# Altium schematic sheet MCU.SchDoc
size A4; SheetNumber: 5; SheetTotal: 8
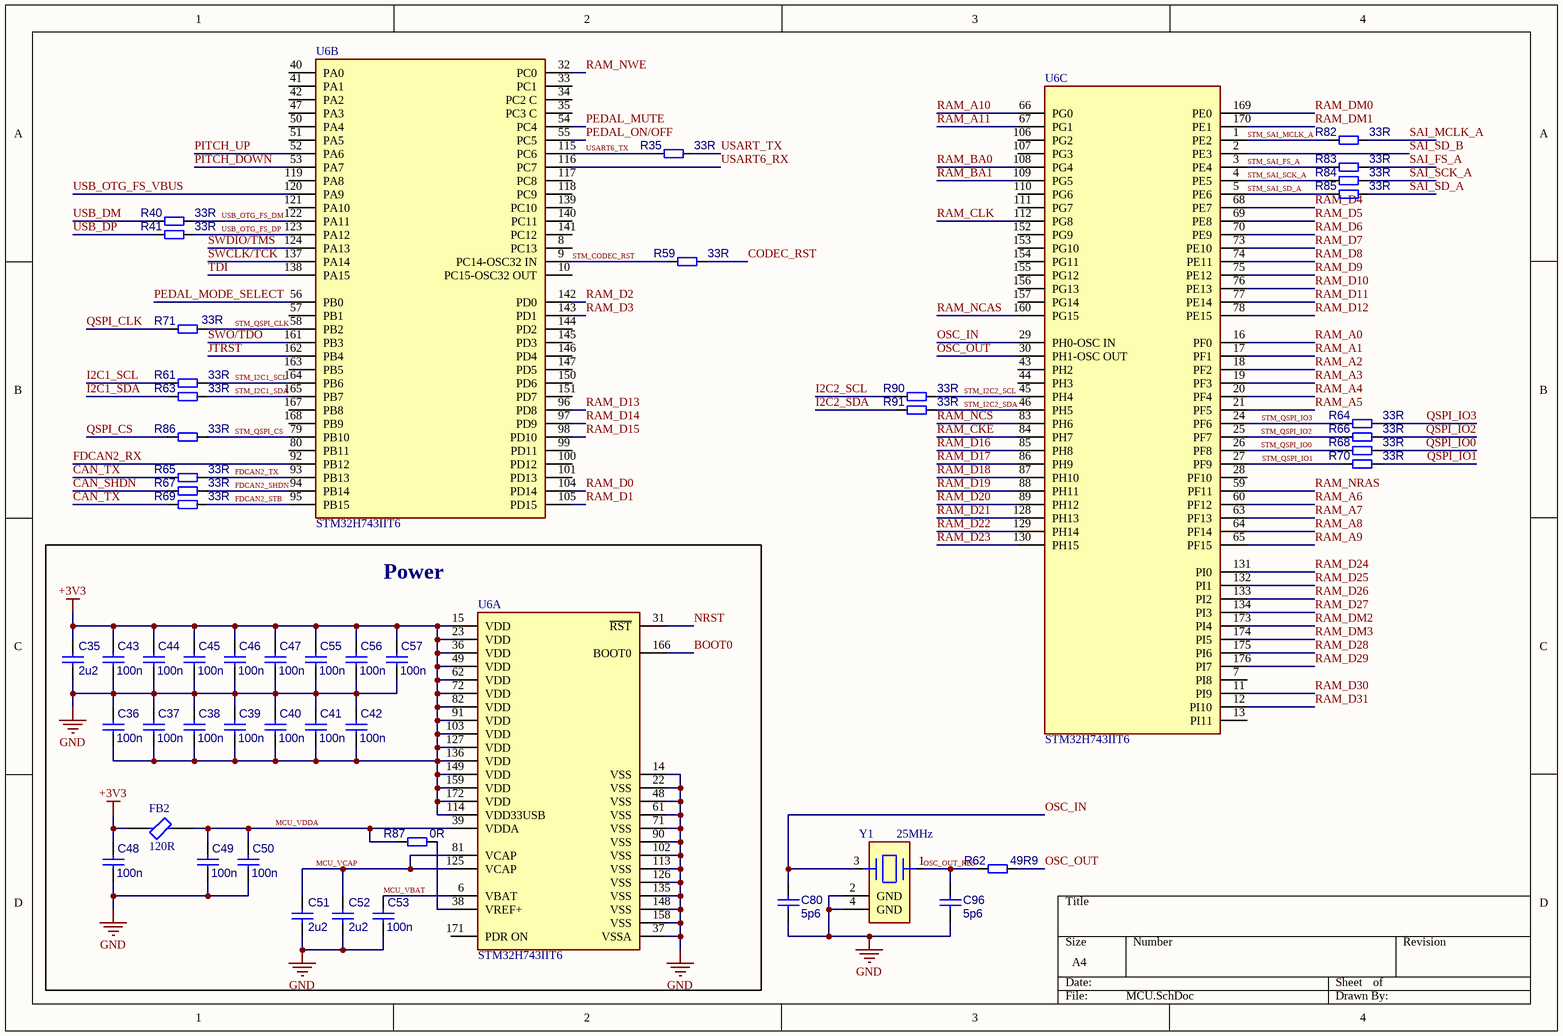
[diagram p0: MCU.SchDoc]

## Parts
C35  2u2  [C_0402]
C36  100n  [CAPC1005X50N_0402]
C37  100n  [CAPC1005X50N_0402]
C38  100n  [CAPC1005X50N_0402]
C39  100n  [CAPC1005X50N_0402]
C40  100n  [CAPC1005X50N_0402]
C41  100n  [CAPC1005X50N_0402]
C42  100n  [CAPC1005X50N_0402]
C43  100n  [CAPC1005X50N_0402]
C44  100n  [CAPC1005X50N_0402]
C45  100n  [CAPC1005X50N_0402]
C46  100n  [CAPC1005X50N_0402]
C47  100n  [CAPC1005X50N_0402]
C48  100n  [CAPC1005X50N_0402]
C49  100n  [CAPC1005X50N_0402]
C50  100n  [CAPC1005X50N_0402]
C51  2u2  [C_0402]
C52  2u2  [C_0402]
C53  100n  [CAPC1005X50N_0402]
C55  100n  [CAPC1005X50N_0402]
C56  100n  [CAPC1005X50N_0402]
C57  100n  [CAPC1005X50N_0402]
C80  5p6  [CAPC1005X50N_0402]
C96  5p6  [CAPC1005X50N_0402]
FB2  120R  [FP-NFZ32BW-w2_8-MFG]
R35  33R  [R_0402]
R40  33R  [R_0402]
R41  33R  [R_0402]
R59  33R  [R_0402]
R61  33R  [R_0402]
R62  49R9  [R_0402]
R63  33R  [R_0402]
R64  33R  [R_0402]
R65  33R  [R_0402]
R66  33R  [R_0402]
R67  33R  [R_0402]
R68  33R  [R_0402]
R69  33R  [R_0402]
R70  33R  [R_0402]
R71  33R  [R_0402]
R82  33R  [R_0402]
R83  33R  [R_0402]
R84  33R  [R_0402]
R85  33R  [R_0402]
R86  33R  [R_0402]
R87  0R  [R_0402]
R90  33R  [R_0402]
R91  33R  [R_0402]
U6  STM32H743IIT6  [FP-LQFP176-1T-MFG]  (parts A,B,C of 3)
Y1  25MHz  [FP-NX2016SA-MFG]

## Blocks framed on the sheet
Power: C35-C53 C55-C57 FB2 R87 U6

## Nets
+3V3: C35.1 C36.2 C37.2 C38.2 C39.2 C40.2 C41.2 C42.2 C43.1 C44.1 C45.1 C46.1 C47.1 C48.1 C55.1 C56.1 C57.1 FB2.1 U6.15(VDD) U6.23(VDD) U6.36(VDD) U6.49(VDD) U6.62(VDD) U6.72(VDD) U6.82(VDD) U6.91(VDD) U6.103(VDD) U6.114(VDD33USB) U6.127(VDD) U6.136(VDD) U6.149(VDD) U6.159(VDD) U6.172(VDD)
GND: C35.2 C36.1 C37.1 C38.1 C39.1 C40.1 C41.1 C42.1 C43.2 C44.2 C45.2 C46.2 C47.2 C48.2 C49.2 C50.2 C51.2 C52.2 C53.2 C55.2 C56.2 C57.2 C80.2 C96.1 U6.14(VSS) U6.22(VSS) U6.37(VSSA) U6.48(VSS) U6.61(VSS) U6.71(VSS) U6.90(VSS) U6.102(VSS) U6.113(VSS) U6.126(VSS) U6.135(VSS) U6.148(VSS) U6.158(VSS) Y1.2(GND) Y1.4(GND)
BOOT0: U6.166(BOOT0)
CAN_SHDN: R67.1
CAN_TX: R65.1 R69.1
CODEC_RST: R59.2
FDCAN2_RX: U6.92(PB12)
FDCAN2_SHDN: R67.2 U6.94(PB14)
FDCAN2_STB: R69.2 U6.95(PB15)
FDCAN2_TX: R65.2 U6.93(PB13)
I2C1_SCL: R61.1
I2C1_SDA: R63.1
I2C2_SCL: R90.1
I2C2_SDA: R91.1
JTRST: U6.162(PB4)
MCU_VBAT: C53.1 U6.6(VBAT)
MCU_VCAP: C51.1 C52.1 U6.81(VCAP) U6.125(VCAP)
MCU_VDDA: C49.1 C50.1 FB2.2 R87.2 U6.39(VDDA)
NRST: U6.31(~{RST})
OSC_IN: C80.1 U6.29(PH0-OSC_IN) Y1.3
OSC_OUT: R62.1 U6.30(PH1-OSC_OUT)
OSC_OUT_RES: C96.2 R62.2 Y1.1
PEDAL_MODE_SELECT: U6.56(PB0)
PEDAL_MUTE: U6.54(PC4)
PEDAL_ON/OFF: U6.55(PC5)
PITCH_DOWN: U6.53(PA7)
PITCH_UP: U6.52(PA6)
QSPI_CLK: R71.2
QSPI_CS: R86.1
QSPI_IO0: R68.2
QSPI_IO1: R70.2
QSPI_IO2: R66.2
QSPI_IO3: R64.2
RAM_A0: U6.16(PF0)
RAM_A1: U6.17(PF1)
RAM_A2: U6.18(PF2)
RAM_A3: U6.19(PF3)
RAM_A4: U6.20(PF4)
RAM_A5: U6.21(PF5)
RAM_A6: U6.60(PF12)
RAM_A7: U6.63(PF13)
RAM_A8: U6.64(PF14)
RAM_A9: U6.65(PF15)
RAM_A10: U6.66(PG0)
RAM_A11: U6.67(PG1)
RAM_BA0: U6.108(PG4)
RAM_BA1: U6.109(PG5)
RAM_CKE: U6.84(PH7)
RAM_CLK: U6.112(PG8)
RAM_D0: U6.104(PD14)
RAM_D1: U6.105(PD15)
RAM_D2: U6.142(PD0)
RAM_D3: U6.143(PD1)
RAM_D4: U6.68(PE7)
RAM_D5: U6.69(PE8)
RAM_D6: U6.70(PE9)
RAM_D7: U6.73(PE10)
RAM_D8: U6.74(PE11)
RAM_D9: U6.75(PE12)
RAM_D10: U6.76(PE13)
RAM_D11: U6.77(PE14)
RAM_D12: U6.78(PE15)
RAM_D13: U6.96(PD8)
RAM_D14: U6.97(PD9)
RAM_D15: U6.98(PD10)
RAM_D16: U6.85(PH8)
RAM_D17: U6.86(PH9)
RAM_D18: U6.87(PH10)
RAM_D19: U6.88(PH11)
RAM_D20: U6.89(PH12)
RAM_D21: U6.128(PH13)
RAM_D22: U6.129(PH14)
RAM_D23: U6.130(PH15)
RAM_D24: U6.131(PI0)
RAM_D25: U6.132(PI1)
RAM_D26: U6.133(PI2)
RAM_D27: U6.134(PI3)
RAM_D28: U6.175(PI6)
RAM_D29: U6.176(PI7)
RAM_D30: U6.11(PI9)
RAM_D31: U6.12(PI10)
RAM_DM0: U6.169(PE0)
RAM_DM1: U6.170(PE1)
RAM_DM2: U6.173(PI4)
RAM_DM3: U6.174(PI5)
RAM_NCAS: U6.160(PG15)
RAM_NCS: U6.83(PH6)
RAM_NRAS: U6.59(PF11)
RAM_NWE: U6.32(PC0)
SAI_FS_A: R83.2
SAI_MCLK_A: R82.2
SAI_SCK_A: R84.2
SAI_SD_A: R85.2
SAI_SD_B: U6.2(PE3)
STM_CODEC_RST: R59.1 U6.9(PC14-OSC32_IN)
STM_I2C1_SCL: R61.2 U6.164(PB6)
STM_I2C1_SDA: R63.2 U6.165(PB7)
STM_I2C2_SCL: R90.2 U6.45(PH4)
STM_I2C2_SDA: R91.2 U6.46(PH5)
STM_QSPI_CLK: R71.1 U6.58(PB2)
STM_QSPI_CS: R86.2 U6.79(PB10)
STM_QSPI_IO0: R68.1 U6.26(PF8)
STM_QSPI_IO1: R70.1 U6.27(PF9)
STM_QSPI_IO2: R66.1 U6.25(PF7)
STM_QSPI_IO3: R64.1 U6.24(PF6)
STM_SAI_FS_A: R83.1 U6.3(PE4)
STM_SAI_MCLK_A: R82.1 U6.1(PE2)
STM_SAI_SCK_A: R84.1 U6.4(PE5)
STM_SAI_SD_A: R85.1 U6.5(PE6)
SWCLK/TCK: U6.137(PA14)
SWDIO/TMS: U6.124(PA13)
SWO/TDO: U6.161(PB3)
TDI: U6.138(PA15)
USART6_RX: U6.116(PC7)
USART6_TX: R35.1 U6.115(PC6)
USART_TX: R35.2
USB_DM: R40.1
USB_DP: R41.1
USB_OTG_FS_DM: R40.2 U6.122(PA11)
USB_OTG_FS_DP: R41.2 U6.123(PA12)
USB_OTG_FS_VBUS: U6.120(PA9)
NetR87_1: R87.1 U6.38(VREF+)

Not connected (* = marked no-connect by the designer): U6 7(PI8) 8(PC13) 10(PC15-OSC32_OUT) 13(PI11) 28(PF10) 33(PC1) 34(PC2_C) 35(PC3_C) 40(PA0) 41(PA1) 42(PA2) 43(PH2) 44(PH3) 47(PA3) 50(PA4) 51(PA5) 57(PB1) 80(PB11) 99(PD11) 100(PD12) 101(PD13) 106(PG2) 107(PG3) 110(PG6) 111(PG7) 117(PC8) 118(PC9) 119(PA8) 121(PA10) 139(PC10) 140(PC11) 141(PC12) 144(PD2) 145(PD3) 146(PD4) 147(PD5) 150(PD6) 151(PD7) 152(PG9) 153(PG10) 154(PG11) 155(PG12) 156(PG13) 157(PG14) 163(PB5) 167(PB8) 168(PB9) 171(PDR_ON)

## Library data of the parts
C35 C51 C52 = CMP-001-00085-2: Capacitor SMD Tantalum 0603 50V / Kyocera AVX F981C225MMA
C36-C50 C53 C55-C57 = CMP-001-00084-2: MLCC 0402 50V / Samsung CL05B104KB54PNC
C80 C96 = CMP-001-00084-2: Capacitor, MLCC, 5.6pF, 50V, NPO, 5%, 0402, T=0,5mm
FB2 = CMP-06046-002300-1: Ferrite Bead 3.6Ω @ 1MHz ±30% 2.55A 0.036Ω 1210 Embossed T/R
R35 R40 R41 R59 R61-R71 R82-R87 R90 R91 = CMP-009-00178-3: Chip 0402 resistor
U6 = CMP-12105-000078-1: IC MCU 32BIT 2MB FLASH 176LQFP; Manufacturer: STMicroelectronics; Number Of I/Os: 140; Number Of Pwm Channels: 2; Standoff Height: 0.05mm; Number Of Uart Channels: 9; Frequency: 400MHz; Core Architecture: ARM Cortex-M7; Ram Size: 1MBytes; Max Supply Voltage: 3.6V; Number Of Timers/Counters: 20; Min Supply Voltage: 1.62V; Number Of I2C Channels: 4; Number Of Cores: 1; Max Junction Temp: +125°C; Data Bus Width: 32bits; Memory Size: 2MBytes; Number Of Adc Channels: 36; Number Of Spi Channels: 6; Interface: I2C,SPI,UART,USART,CAN,USB,LIN,IrDA,Ethernet,SMBus,Other; Number Of A/D Converters: 3; Digikey Description: IC MCU 32BIT 2MB FLASH 176LQFP; Temperature: -40°C to +125°C; Package: LQFP176-1T; RoHS: TRUE; Memory Type: FLASH; Device Class L3: Microcontrollers; Manufacturer Part Number: STM32H743IIT6; Mouser Description: MCU 32-Bit STM32 ARM Cortex M7 RISC 2MB Flash 1.8V/2.5V/3.3V 176-Pin LQFP Tray; Category: IC; Automotive: No; Ambient Temperature Range High: +85°C; Number Of Usb Channels: 2; ComponentLink2URL: https://www.st.com/resource/en/datasheet/stm32h743ii.pdf; Lead Free: Yes; Ambient Temperature Range Low: -40°C; ComponentLink2Description: Datasheet; Device Class L2: Embedded Processors and Controllers; Octopart: https://octopart.com/stm32h743iit6-stmicroelectronics-76372526; Device Class L1: Integrated Circuits (ICs); Height: 1.6mm; Temperature Range Low: -40°C; Temperature Range High: +125°C; Number Of Ethernet Channels: 1; Ipc Land Pattern Name: QFP50P2600X2600X160-176
Y1 = CMP-200220-000017-1: NX2016SA 25MHz / Crystal 25MHz, 6pF, +-20ppm, 80ohms max, SMD; Frequency: 32MHz; Load Capacitance: 8pF; ESR (Equivalent Series Resistance): 60R; Ratings: AEC-Q200; Mount: Surface Mount; Case/Package: SMD/SMT; Packaging: Tape and Reel; Min Operating Temperature: -40°C; Max Operating Temperature: 125°C